# Altium project Ajax.PrjPcb
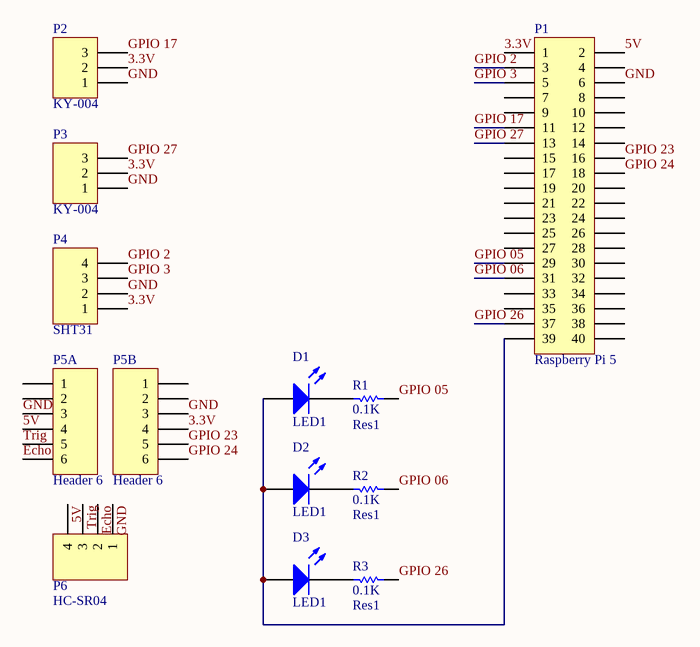
[diagram p0: HatBoard.SchDoc]
1 sheet, 13 parts. Net scope: global (net labels, ports and power ports of the same name join across sheets).
Board file: HatBoard.PcbDoc

## Sheet HatBoard.SchDoc
size A; SheetNumber: 1; SheetTotal: 1; SPICEModelCacheWKHDOBIC: <root> / <DocumentId>WKHDOBIC</DocumentId> / <CacheFrame Number="0"> / <Model Name="led1" Kind="MDL"> / <Text>*Typ RED GaAs LED: Vf=1.7V Vr=4V If=40mA trr=3uS / *LED Pinout: 1=A, 2=K / .MODEL LED1 D (IS=93.2P RS=42M N=3.73 BV=4 IBV=10U / + CJO=2.97P VJ=.75 M=.333 TT=4.32U)</Text> / </Model> / </CacheFrame> / </root>

### Parts
D1  LED1  [LED-1]
D2  LED1  [LED-1]
D3  LED1  [LED-1]
P1  Raspberry Pi 5  [HDR2X20]
P2  KY-004  [HDR1X3]
P3  KY-004  [HDR1X3]
P4  SHT31  [HDR1X4]
P5A  Header 6  [HDR1X6]
P5B  Header 6  [HDR1X6]
P6  HC-SR04  [HDR1X4]
R1  Res1  value 0.1K  [AXIAL-0.4]
R2  Res1  value 0.1K  [AXIAL-0.4]
R3  Res1  value 0.1K  [AXIAL-0.4]

### Nets
3.3V: P1.1 P2.2 P3.2 P4.1 P5B.4
5V: P1.2 P5A.4 P6.4
Echo: P5A.6 P6.2
GND: P1.6 P2.1 P3.1 P4.2 P5A.3 P5B.3 P6.1
GPIO 2: P1.3 P4.4
GPIO 3: P1.5 P4.3
GPIO 05: P1.29 R1.1
GPIO 06: P1.31 R2.1
GPIO 17: P1.11 P2.3
GPIO 23: P1.16 P5B.5
GPIO 24: P1.18 P5B.6
GPIO 26: P1.37 R3.1
GPIO 27: P1.13 P3.3
Trig: P5A.5 P6.3
NetD1_1: D1.1(A) D2.1(A) D3.1(A) P1.39
NetD1_2: D1.2(K) R1.2
NetD2_2: D2.2(K) R2.2
NetD3_2: D3.2(K) R3.2

Not connected (* = marked no-connect by the designer): P1 4 7 8 9 10 12 14 15 17 19 20 21 22 23 24 25 26 27 28 30 32 33 34 35 36 38 40; P5A 1 2; P5B 1 2

### Library data of the parts
D1-D3 = LED1: Typical RED GaAs LED; Published: 8-Jun-2000; LatestRevisionDate: 08-Jul-2005; LatestRevisionNote: Mech Layer 1 removed.; PackageReference: LED-1; Publisher: Altium Limited; PackageDescription: LED; 2 Leads
P1 = Header 20X2: Header, 20-Pin, Dual row; LatestRevisionDate: 17-Jul-2002; LatestRevisionNote: Re-released for DXP Platform.; Publisher: Altium Limited
P2 P3 = Header 3: Header, 3-Pin; LatestRevisionDate: 17-Jul-2002; LatestRevisionNote: Re-released for DXP Platform.; Publisher: Altium Limited
P4 P6 = Header 4: Header, 4-Pin; LatestRevisionDate: 17-Jul-2002; LatestRevisionNote: Re-released for DXP Platform.; Publisher: Altium Limited
P5A P5B = Header 6: Header, 6-Pin; LatestRevisionDate: 17-Jul-2002; LatestRevisionNote: Re-released for DXP Platform.; Publisher: Altium Limited
R1-R3 = Res1: Resistor; Published: 8-Jun-2000; LatestRevisionDate: 17-Jul-2002; LatestRevisionNote: Re-released for DXP Platform.; PackageReference: AXIAL-0.3; Publisher: Altium Limited; PackageDescription: Axial Device, Thru-Hole; 2 Leads; 0.3 in Pin Spacing